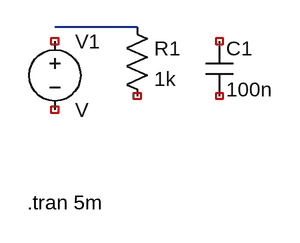
[diagram p0: schematic buoy-filter.asc]
buoy-filter.asc, the LTspice schematic file:
Version 4
SHEET 1 880 680
WIRE 128 96 32 96
SYMBOL res 112 80 R0
SYMATTR InstName R1
SYMATTR Value 1k
SYMBOL cap 208 112 R0
SYMATTR InstName C1
SYMATTR Value 100n
SYMBOL voltage 32 96 R0
SYMATTR InstName V1
TEXT 0 300 Left 2 !.tran 5m

The netlist it stands for:
* buoy-filter.asc
R1 N001 NC_01 1k
C1 NC_02 NC_03 100n
V1 NC_04 NC_05 V
.tran 5m
.backanno
.end